# EasyEDA Pro project ProPrj_基于SAM2695的midiSynth模块_2026-04-13.epro

# Schematic Schematic1
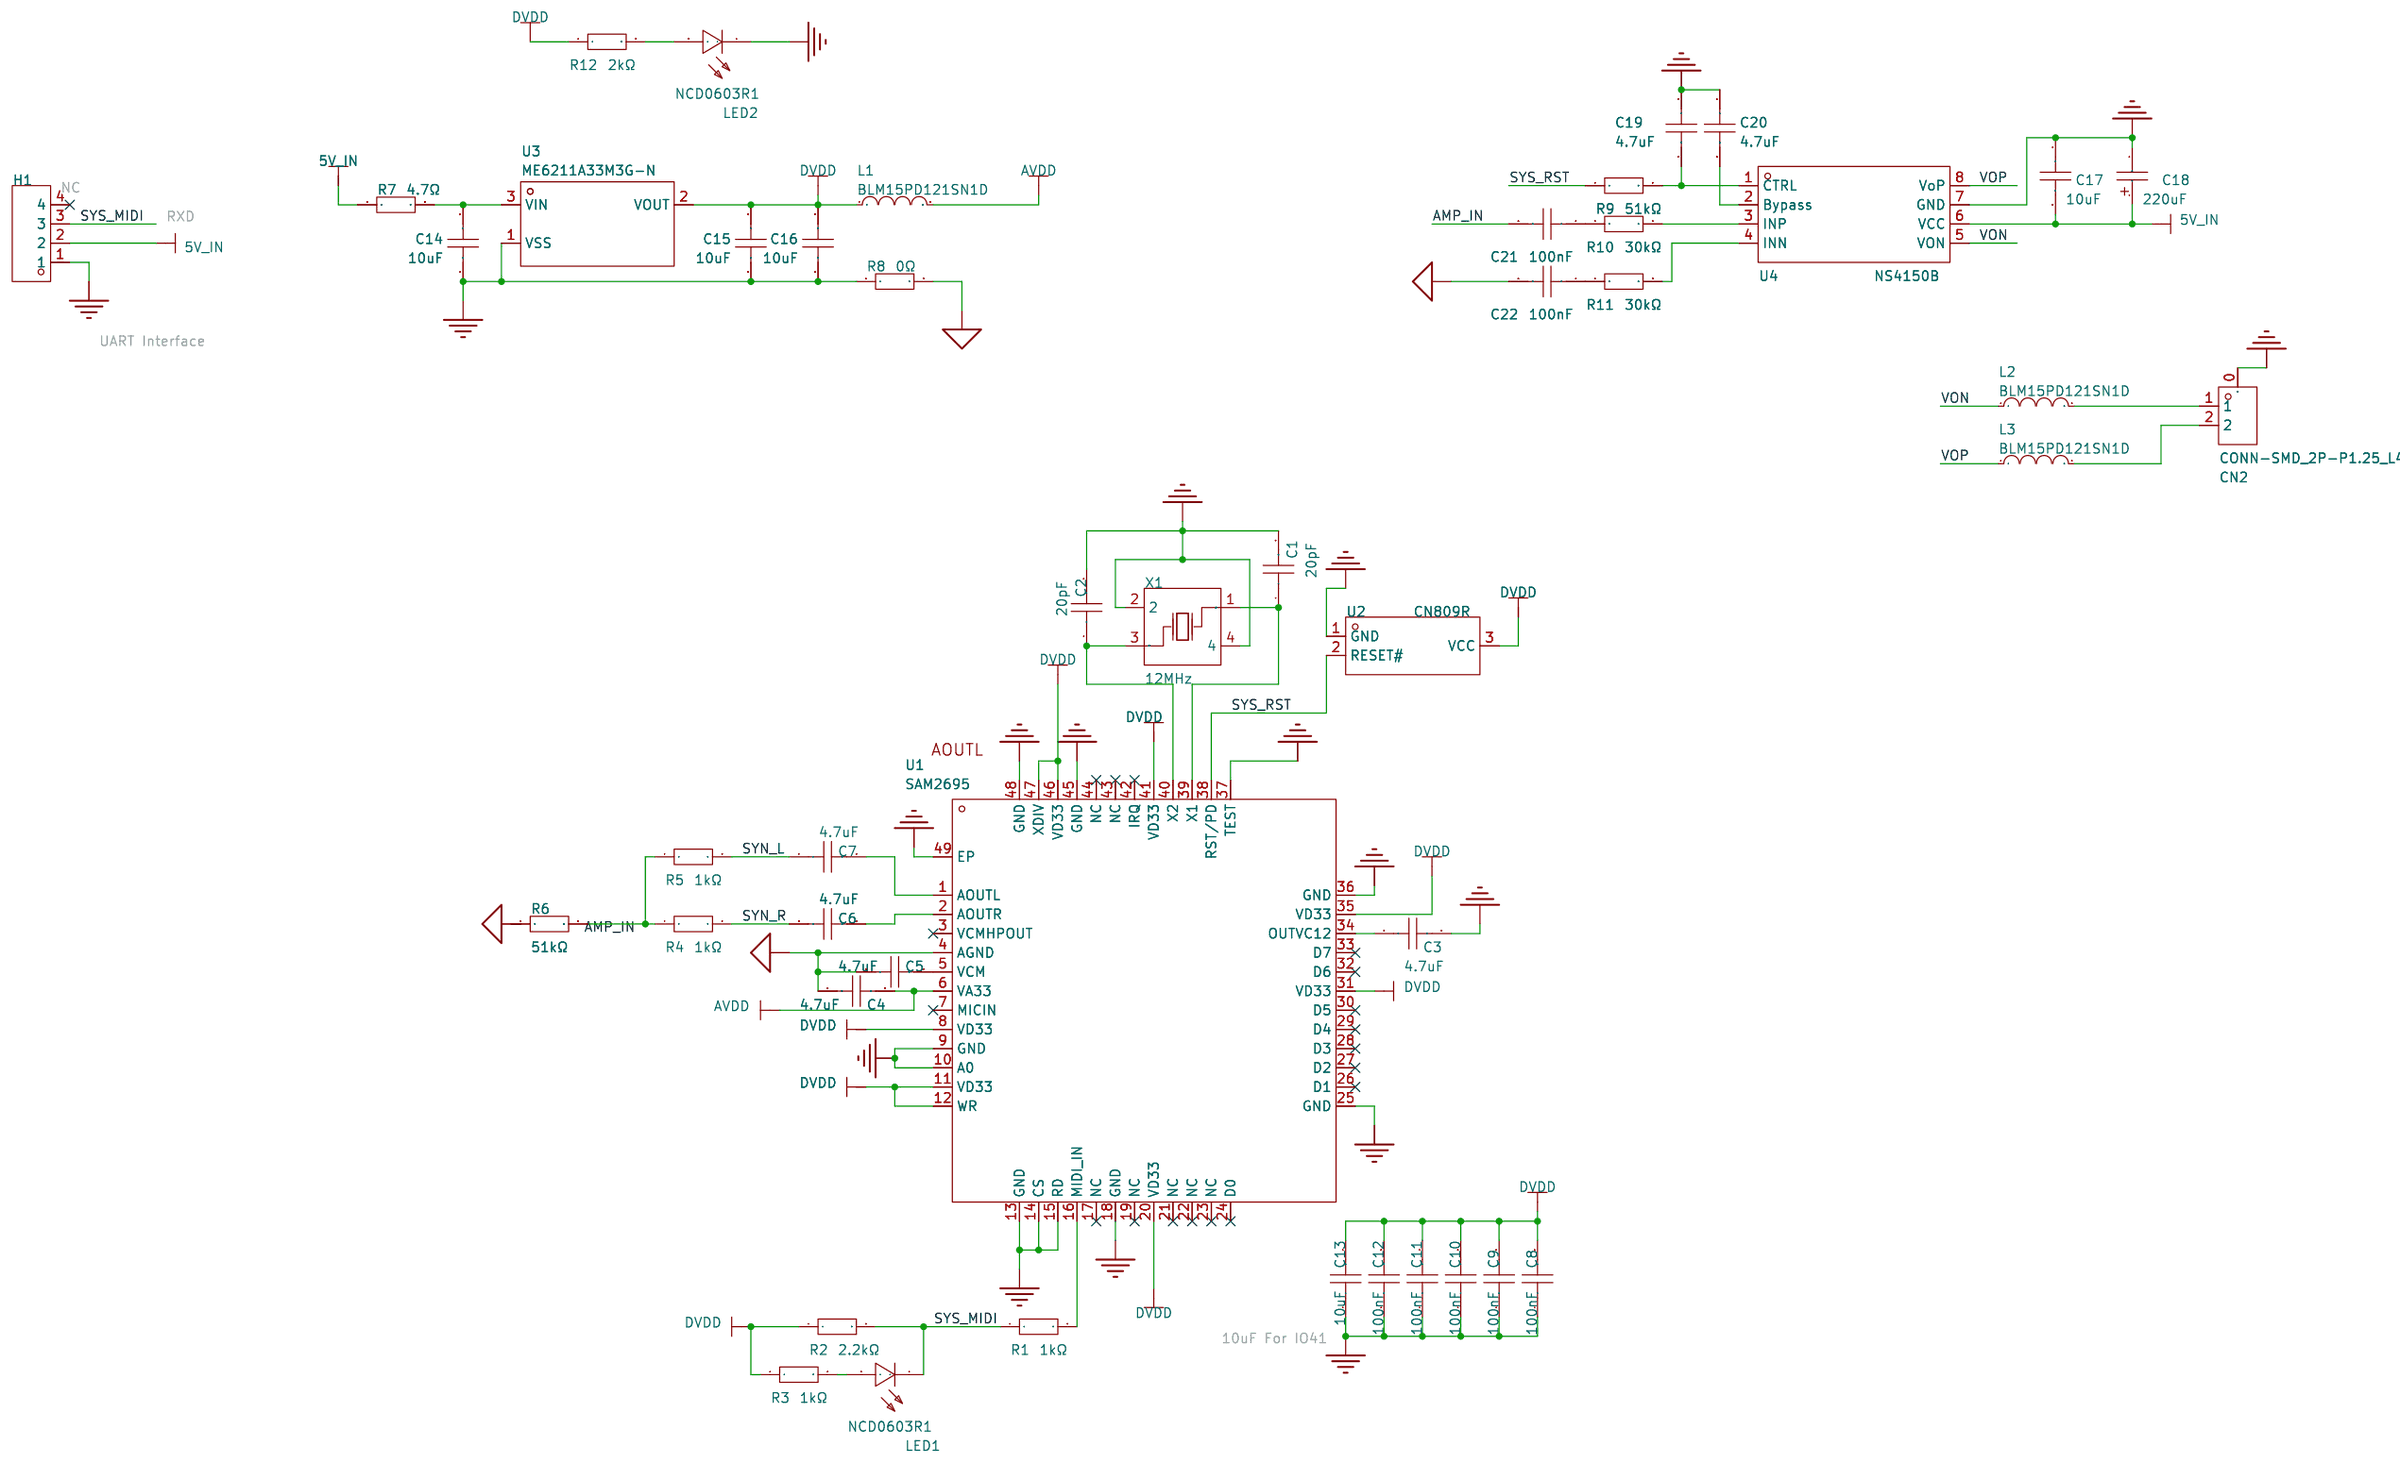
[diagram p0: schematic sheet]

## Parts
C1  20pF  [C0402]
C2  20pF  [C0402]
C3  4.7uF  [C0402]
C4  4.7uF  [C0402]
C5  4.7uF  [C0402]
C6  4.7uF  [C0402]
C7  4.7uF  [C0402]
C8  100nF  [C0402]
C9  100nF  [C0402]
C10  100nF  [C0402]
C11  100nF  [C0402]
C12  100nF  [C0402]
C13  10uF  [C0402]
C14  10uF  [C0402]
C15  10uF  [C0402]
C16  10uF  [C0402]
C17  10uF  [C0402]
C18  220uF  [CASE-B_3528]
C19  4.7uF  [C0402]
C20  4.7uF  [C0402]
C21  100nF  [C0402]
C22  100nF  [C0402]
CN2  CONN-SMD_2P-P1.25_L4.4-W7.4  [CONN-SMD_2P-P1.25_L4.4-W7.4]
H1  -  [HDR-TH_4P-P2.54-V-M]
L1  BLM15PD121SN1D  [L0402]
L2  BLM15PD121SN1D  [L0402]
L3  BLM15PD121SN1D  [L0402]
LED1  NCD0603R1  [LED0603-RD_RED]
LED2  NCD0603R1  [LED0603-RD_RED]
R1  1kΩ  [R0402]
R2  2.2kΩ  [R0402]
R3  1kΩ  [R0402]
R4  1kΩ  [R0402]
R5  1kΩ  [R0402]
R6  51kΩ  [R0402]
R7  4.7Ω  [R0402]
R8  0Ω  [R0402]
R9  51kΩ  [R0402]
R10  30kΩ  [R0402]
R11  30kΩ  [R0402]
R12  2kΩ  [R0402]
U1  SAM2695  [QFN-48_L6.0-W6.0-P0.40-TL-EP4.2]
U2  CN809R  [SOT-23-3_L2.9-W1.3-P1.90-LS2.4-BR]
U3  ME6211A33M3G-N  [SOT-23-3_L2.9-W1.6-P1.90-LS2.8-BR]
U4  NS4150B  [MSOP-8_L3.0-W3.0-P0.65-LS5.0-BL]
X1  12MHz  [CRYSTAL-SMD_4P-L2.5-W2.0-BL]

## Library data of the parts
C1 C2 = GRM1555C1H200JA01D: 容值:20pF;精度:±5%;额定电压:50V;材质(温度系数):C0G;; LCSC Part Name: 20pF ±5% 50V; Supplier Part: C76959; Manufacturer: muRata(村田); Supplier Footprint: 0402; Datasheet: https://atta.szlcsc.com/upload/public/pdf/source/20180307/C76959_15204091273971407747.pdf; Supplier: LCSC; Tolerance: ±5%; Voltage Rated: 50V; Temperature Coefficient: C0G
C3-C7 C19 C20 = GRM155R61E475ME15D: 容值:4.7uF;额定电压:25V;材质(温度系数):X5R;; LCSC Part Name: 4.7uF 25V; Supplier Part: C2858031; Manufacturer: muRata(村田); Supplier Footprint: 0402; Datasheet: https://atta.szlcsc.com/upload/public/pdf/source/20170523/1495533985505.pdf; Supplier: LCSC; Voltage Rated: 25V; Temperature Coefficient: X5R
C8-C12 C21 C22 = GRM155R71H104KE14D: 容值:100nF;精度:±10%;额定电压:50V;材质(温度系数):X7R;; LCSC Part Name: 100nF ±10% 50V; Supplier Part: C77020; Manufacturer: muRata(村田); Supplier Footprint: 0402; Datasheet: https://atta.szlcsc.com/upload/public/pdf/source/20180326/C77020_39BD49C951FF1AF0DB1F1FAC5AC1E401.pdf; Supplier: LCSC; Tolerance: ±10%; Voltage Rated: 50V; Temperature Coefficient: X7R
C13-C17 = GRM155R61A106ME44D: 容值:10uF;精度:±20%;额定电压:10V;材质(温度系数):X5R;; LCSC Part Name: 10uF ±20% 10V; Supplier Part: C77000; Manufacturer: muRata(村田); Supplier Footprint: 0402; Datasheet: https://atta.szlcsc.com/upload/public/pdf/source/20180530/C77000_4866797CFE3A842CD03C597EBD6AE6CD.pdf; Supplier: LCSC; Tolerance: ±20%; Voltage Rated: 10V; Temperature Coefficient: X5R
C18 = TLJB227M006R0500: 容值:220uF;精度:±20%;额定电压:6.3V;等效串联电阻:500mΩ@100kHz;; LCSC Part Name: 220uF ±20% 6.3V; Supplier Part: C30242; Manufacturer: Kyocera AVX; Supplier Footprint: CASE-B-3528; Datasheet: https://atta.szlcsc.com/upload/public/pdf/source/20181016/C313517_95E099C94D57B8A6005DAF15C3058A23.pdf; Supplier: LCSC; Tolerance: ±20%; Rated Voltage: 6.3V; Equivalent Series Resistance(ESR): 500mΩ@100kHz; Operating Temperature: -55℃~+125℃
CN2 = CONN-SMD_2P-P1.25_L4.4-W7.4: Supplier Part: C9900018342; Supplier Footprint: CONN-SMD_2P; JLCPCB Part Class: 扩展库; Supplier: LCSC
H1 = HDR-M_2.54_1x4P: Supplier Part: C492403; Supplier Footprint: 插件
L1-L3 = BLM15PD121SN1D: 标称阻抗@测试频率:120Ω@100MHz;误差:±25%;直流电阻(RDC):90mΩ;; LCSC Part Name: 单路 0402磁珠 阻抗120Ω@100MHz; Supplier Part: C76891; Manufacturer: muRata(村田); Supplier Footprint: 0402; Datasheet: https://atta.szlcsc.com/upload/public/pdf/source/20181120/C333978_3E581FB55966932B05020139ABDE8E01.pdf; Supplier: LCSC; Impedance @ Frequency: 120Ω@100MHz; Tolerance: ±25%; DC Resistance: 90mΩ; Current Rating: 1.3A; Circuits: 1
LED1 LED2 = NCD0603R1_C84263: 灯头类型:-;发光颜色:红色;正向电压(VF):1.6V~2.6V;功率:65mW;正向电流:20mA;主波长:615nm~630nm;二极管配置:独立二极管;透镜颜色:无色透明透镜;色温:-;发光强度:80mcd~220mcd;发光角度:130°;载带方式:-;工作温度:-30℃~+85℃;; Supplier Part: C84263; Manufacturer: 国星光电; Supplier Footprint: 0603; Datasheet: https://atta.szlcsc.com/upload/public/pdf/source/20200820/C84263_DABC6A75E58F576973B407FDBA283D60.pdf; Supplier: LCSC; Emitted Color: 红色; Forward Voltage (VF): 1.6V~2.6V; Power Dissipation: 65mW; Forward Current: 20mA; Dominant Wavelength: 615nm~630nm; Diode Configuration: 独立二极管; Lens Color: 无色透明透镜; Luminous Intensity: 80mcd~220mcd; Viewing Angle: 130°; Operating Temperature: -30℃~+85℃
R1 R3-R5 = 0402WGF1001TCE: 电阻类型:厚膜电阻;阻值:1kΩ;精度:±1%;功率:62.5mW;最大工作电压:50V;温度系数:±100ppm/℃;; LCSC Part Name: 1kΩ ±1% 62.5mW 厚膜电阻; Supplier Part: C11702; Manufacturer: UNI-ROYAL(厚声); Supplier Footprint: 0402; Datasheet: https://atta.szlcsc.com/upload/public/pdf/source/20200306/C422600_1E6D84923E4A46A82E41ADD87F860B5C.pdf; Supplier: LCSC; Type: 厚膜电阻; Tolerance: ±1%; Power(Watts): 62.5mW; Overload Voltage (Max): 50V; Temperature Coefficient: ±100ppm/℃; Operating Temperature Range: -55℃~+155℃
R2 = 0402WGF2201TCE: 电阻类型:厚膜电阻;阻值:2.2kΩ;精度:±1%;功率:62.5mW;最大工作电压:50V;温度系数:±100ppm/℃;; LCSC Part Name: 2.2kΩ ±1% 62.5mW 厚膜电阻; Supplier Part: C25879; Manufacturer: UNI-ROYAL(厚声); Supplier Footprint: 0402; Datasheet: https://atta.szlcsc.com/upload/public/pdf/source/20200306/C422600_1E6D84923E4A46A82E41ADD87F860B5C.pdf; Supplier: LCSC; Type: 厚膜电阻; Tolerance: ±1%; Power(Watts): 62.5mW; Overload Voltage (Max): 50V; Temperature Coefficient: ±100ppm/℃; Operating Temperature Range: -55℃~+155℃
R6 R9 = 0402WGF5102TCE: 电阻类型:厚膜电阻;阻值:51kΩ;精度:±1%;功率:62.5mW;最大工作电压:50V;温度系数:±100ppm/℃;; LCSC Part Name: 51kΩ ±1% 62.5mW 厚膜电阻; Supplier Part: C25794; Manufacturer: UNI-ROYAL(厚声); Supplier Footprint: 0402; Datasheet: https://atta.szlcsc.com/upload/public/pdf/source/20200306/C422600_1E6D84923E4A46A82E41ADD87F860B5C.pdf; Supplier: LCSC; Type: 厚膜电阻; Tolerance: ±1%; Power(Watts): 62.5mW; Overload Voltage (Max): 50V; Temperature Coefficient: ±100ppm/℃; Operating Temperature Range: -55℃~+155℃
R7 = 0402WGF470KTCE: 电阻类型:厚膜电阻;阻值:4.7Ω;精度:±1%;功率:62.5mW;最大工作电压:50V;温度系数:±200ppm/℃;; LCSC Part Name: 4.7Ω ±1% 62.5mW 厚膜电阻; Supplier Part: C25121; Manufacturer: UNI-ROYAL(厚声); Supplier Footprint: 0402; Datasheet: https://atta.szlcsc.com/upload/public/pdf/source/20200306/C422600_1E6D84923E4A46A82E41ADD87F860B5C.pdf; Supplier: LCSC; Type: 厚膜电阻; Tolerance: ±1%; Power(Watts): 62.5mW; Overload Voltage (Max): 50V; Temperature Coefficient: ±200ppm/℃; Operating Temperature Range: -55℃~+155℃
R8 = 0402WGF0000TCE: 电阻类型:厚膜电阻;阻值:0Ω;精度:±1%;功率:62.5mW;最大工作电压:50V;温度系数:±800ppm/℃;; LCSC Part Name: 0Ω ±1% 62.5mW 厚膜电阻; Supplier Part: C17168; Manufacturer: UNI-ROYAL(厚声); Supplier Footprint: 0402; Datasheet: https://atta.szlcsc.com/upload/public/pdf/source/20200306/C422600_1E6D84923E4A46A82E41ADD87F860B5C.pdf; Supplier: LCSC; Type: 厚膜电阻; Tolerance: ±1%; Power(Watts): 62.5mW; Overload Voltage (Max): 50V; Temperature Coefficient: ±800ppm/℃; Operating Temperature Range: -55℃~+155℃
R10 R11 = 0402WGF3002TCE: 电阻类型:厚膜电阻;阻值:30kΩ;精度:±1%;功率:62.5mW;最大工作电压:50V;温度系数:±100ppm/℃;; LCSC Part Name: 30kΩ ±1% 62.5mW 厚膜电阻; Supplier Part: C25776; Manufacturer: UNI-ROYAL(厚声); Supplier Footprint: 0402; Datasheet: https://atta.szlcsc.com/upload/public/pdf/source/20200306/C422600_1E6D84923E4A46A82E41ADD87F860B5C.pdf; Supplier: LCSC; Type: 厚膜电阻; Tolerance: ±1%; Power(Watts): 62.5mW; Overload Voltage (Max): 50V; Temperature Coefficient: ±100ppm/℃; Operating Temperature Range: -55℃~+155℃
R12 = 0402WGF2001TCE: 电阻类型:厚膜电阻;阻值:2kΩ;精度:±1%;功率:62.5mW;最大工作电压:50V;温度系数:±100ppm/℃;; LCSC Part Name: 2kΩ ±1% 62.5mW 厚膜电阻; Supplier Part: C4109; Manufacturer: UNI-ROYAL(厚声); Supplier Footprint: 0402; Datasheet: https://atta.szlcsc.com/upload/public/pdf/source/20200306/C422600_1E6D84923E4A46A82E41ADD87F860B5C.pdf; Supplier: LCSC; Type: 厚膜电阻; Tolerance: ±1%; Power(Watts): 62.5mW; Overload Voltage (Max): 50V; Temperature Coefficient: ±100ppm/℃; Operating Temperature Range: -55℃~+155℃
U1 = SAM2695: Supplier Part: C2894839; Supplier Footprint: QFN-48-EP(6x6); JLCPCB Part Class: 扩展库; Supplier: LCSC
U2 = CN809R: Supplier Part: C840519; Manufacturer: CONSONANCE(上海如韵); Supplier Footprint: SOT-23-3; Datasheet: https://atta.szlcsc.com/upload/public/pdf/source/20200918/C840515_7DFC99A23260E65C6304EE619FD5F333.pdf; Supplier: LCSC
U3 = ME6211A33M3G-N: 输出类型:固定;最大输入电压:6V;输出电压:3.3V;最大输出电流:500mA;电源纹波抑制比(PSRR):70dB;输出极性:正极;; LCSC Part Name: 输入6V 输出3.3V 500mA; Supplier Part: C168807; Manufacturer: MICRONE(南京微盟); Supplier Footprint: SOT-23; Datasheet: https://atta.szlcsc.com/upload/public/pdf/source/20180224/C168807_15194366627921363679.pdf; Supplier: LCSC; Output Type: 固定; Maximum Input Voltage: 6V; Output Voltage: 3.3V; MAX Output Current: 500mA; Power Supply Rejection Ratio (PSRR): 70dB; Dropout Voltage: 260mV@(200mA); Output Polarity: 正极; Number of Outputs: 1
U4 = NS4150B_C189961: 功放类型:D类功放;输出功率:3Wx1@4Ω;; Supplier Part: C189961; Manufacturer: Nsiway(纳芯威); Supplier Footprint: MSOP-8; Datasheet: https://atta.szlcsc.com/upload/public/pdf/source/20220916/DAE631F3909B9CBB38BDE76E3E6D5896.pdf; Supplier: LCSC; Type of Power Amplifier: D类功放; Output Power: 3Wx1@4Ω; Supply Voltage: 3V~5.25V
X1 = TXM12M0004252LBCEO00T: 晶振类型:贴片晶振;频率:12MHz;常温频差:±10ppm;外接负载电容:20pF;频率稳定度(全温):±30ppm;; LCSC Part Name: 12MHz ±10ppm 20pF; Supplier Part: C284156; Manufacturer: YJX(雅晶鑫); Supplier Footprint: SMD2520-4P; Datasheet: https://atta.szlcsc.com/upload/public/pdf/source/20180910/C284156_33E9081587E4031EDA871554E6F6FE96.pdf; Supplier: LCSC; Crystal Type: 贴片晶振; Normal temperature Frequency Tolerance: ±10ppm; External load capacitor: 20pF; Frequency Stability(Full temperature range): ±30ppm; Equivalent Series Resistance (ESR): 120Ω; Operating Temperature: -40℃~+85℃

## Nets
5V_IN: C17.2 C18.1 H1.2 R7.1 U4.6(VCC)
AGND: C4.1 C5.1 C22.2 R6.1 R8.2 U1.4(AGND)
AVDD: C4.2 L1.2 U1.6(VA33)
DVDD: C8.2 C9.2 C10.2 C11.2 C12.2 C13.2 C15.2 C16.2 L1.1 R2.1 R3.1 R12.1 U1.8(VD33) U1.11(VD33) U1.12(WR) U1.20(VD33) U1.31(VD33) U1.35(VD33) U1.41(VD33) U1.46(VD33) U1.47(XDIV) U2.3(VCC) U3.2(VOUT)
GND: C1.2 C2.2 C3.2 C8.1 C9.1 C10.1 C11.1 C12.1 C13.1 C14.1 C15.1 C16.1 C17.1 C18.2 C19.2 C20.2 CN2.0 H1.1 LED2.1(K) R8.1 U1.9(GND) U1.10(A0) U1.13(GND) U1.14(CS) U1.15(RD) U1.18(GND) U1.25(GND) U1.36(GND) U1.37(TEST) U1.45(GND) U1.48(GND) U1.49(EP) U2.1(GND) U3.1(VSS) U4.7(GND) X1.2 X1.4
AMP_IN: C21.2 R4.1 R5.1 R6.2
SYN_L: C7.1 R5.2
SYN_R: C6.1 R4.2
SYS_MIDI: H1.3 LED1.1(K) R1.1 R2.2
SYS_RST: R9.1 U1.38(RST/PD) U2.2(RESET#)
VON: L2.1 U4.5(VON)
VOP: L3.1 U4.8(VoP)
$1N621: C3.1 U1.34(OUTVC12)
$1N927: C2.1 U1.40(X2) X1.3(OSC2)
$1N941: C1.1 U1.39(X1) X1.1(OSC1)
$1N1407: R1.2 U1.16(MIDI_IN)
$1N1648: LED1.2(A) R3.2
$1N1866: C5.2 U1.5(VCM)
$1N1969: C6.2 U1.2(AOUTR)
$1N2010: C7.2 U1.1(AOUTL)
$1N2925: C14.2 R7.2 U3.3(VIN)
$1N3698: C19.1 R9.2 U4.1(CTRL)
$1N3770: C20.1 U4.2(Bypass)
$1N3844: R10.2 U4.3(INP)
$1N3921: R11.2 U4.4(INN)
$1N3961: C21.1 R10.1
$1N4002: C22.1 R11.1
$1N4108: CN2.2 L3.2
$1N4183: CN2.1 L2.2
$1N4483: LED2.2(A) R12.2

Not connected (* = marked no-connect by the designer): H1 4*; U1 3(VCMHPOUT)* 7(MICIN)* 17(NC)* 19(NC)* 21(NC)* 22(NC)* 23(NC)* 24(D0)* 26(D1)* 27(D2)* 28(D3)* 29(D4)* 30(D5)* 32(D6)* 33(D7)* 42(IRQ)* 43(NC)* 44(NC)*

## Notes on the sheet
- NC
- RXD
- UART Interface
- 10uF For IO41

# Board PCB1
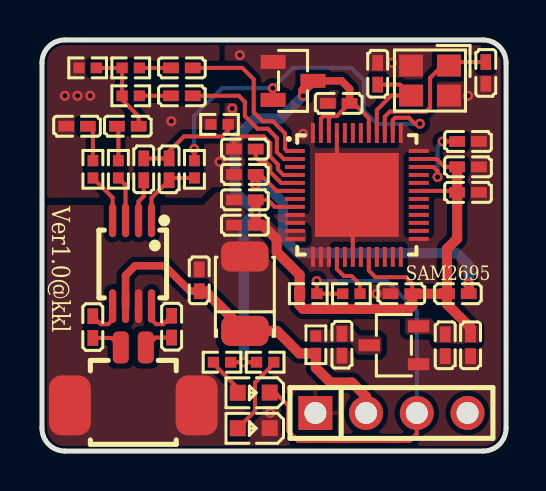
[diagram p1: board, top side]
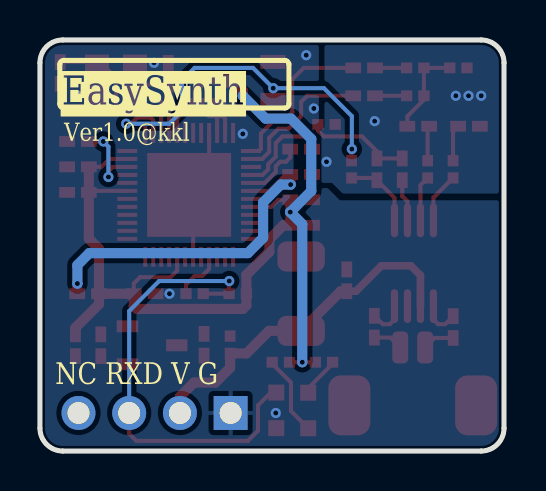
[diagram p2: board, bottom side, seen from below]

Outline 23.24 x 20.57 mm; copper layers: Top Layer, Bottom Layer. Coordinates in mm from the lower left corner of the outline.
Outline path: 0,19.43 0,1.14 arc(0.33,0.33) 1.14,0 22.1,0 arc(22.91,0.33) 23.24,1.14 23.24,19.43 arc(22.91,20.24) 22.1,20.57 1.14,20.57 arc(0.33,20.24) 0,19.43
Stack: Top Layer 0.035mm / Dielectric1 1.51mm FR4 er 4.5 / Bottom Layer 0.035mm

## Design rules (mm)
net VOP: DP1
net VON: DP1
net $1N4183: DP2
net $1N4108: DP2
template: 自定义配置
spacing copperThickness1oz (default): track to track 0.102, other pairs 0.152 to 0.3
spacing copperThickness2oz: track to track 0.203, other pairs 0.152 to 0.3
track width copperThickness1oz (default): min 0.127, default 0.254, max 2.54
track width copperThickness2oz: min 0.203, default 0.254, max 2.54
differential pair differentialPair (default): width min 0.127, default 0.254, max 2.54; gap min 0.152, default 0.152
via viaSize (default): diameter min 0.5, default 0.61, max 10; hole min 0.254, default 0.305, max 6.3

## Placement (name value [footprint] x y rotation side)
C1  20pF  [C0402]  22.23 18.92 270 top
C2  20pF  [C0402]  16.81 18.88 90 top
C3  4.7uF  [C0402]  21.34 15.49 0 top
C4  4.7uF  [C0402]  10.16 13.84 0 top
C5  4.7uF  [C0402]  10.16 15.11 0 top
C6  4.7uF  [C0402]  7.01 17.78 0 top
C7  4.7uF  [C0402]  7.01 19.18 0 top
C8  100nF  [C0402]  10.16 11.3 0 top
C9  100nF  [C0402]  21.34 14.22 180 top
C10  100nF  [C0402]  21.34 12.95 180 top
C11  100nF  [C0402]  18 7.87 0 top
C12  100nF  [C0402]  10.16 12.57 0 top
C13  10uF  [C0402]  14.86 17.4 0 top
C14  10uF  [C0402]  15.02 5.32 90 top
C15  10uF  [C0402]  20.19 5.29 90 top
C16  10uF  [C0402]  21.46 5.29 90 top
C17  10uF  [C0402]  7.87 8.54 270 top
C18  220uF  [CASE-B_3528]  10.16 7.87 90 top
C19  4.7uF  [C0402]  6.37 14.1 90 top
C20  4.7uF  [C0402]  5.1 14.1 90 top
C21  100nF  [C0402]  4.3 16.26 0 top
C22  100nF  [C0402]  1.75 16.26 180 top
CN2  -  [CONN-SMD_2P-P1.25_L4.4-W7.4]  4.57 3.74 0 top
H1  -  [HDR-TH_4P-P2.54-V-M]  17.5 1.9 0 top
L1  BLM15PD121SN1D  [L0402]  20.83 7.87 0 top
L2  BLM15PD121SN1D  [L0402]  2.54 6.2 270 top
L3  BLM15PD121SN1D  [L0402]  6.49 6.22 270 top
LED1  NCD0603R1  [LED0603-RD_RED]  10.61 2.92 180 top
LED2  NCD0603R1  [LED0603-RD_RED]  10.61 1.14 180 top
R1  1kΩ  [R0402]  15.49 7.87 0 top
R2  2.2kΩ  [R0402]  13.34 7.87 0 top
R3  1kΩ  [R0402]  9.02 4.44 180 top
R4  1kΩ  [R0402]  4.45 17.78 0 top
R5  1kΩ  [R0402]  4.45 19.18 0 top
R6  51kΩ  [R0402]  2.29 19.18 0 top
R7  4.7Ω  [R0402]  13.72 5.32 90 top
R8  0Ω  [R0402]  8.89 16.35 180 top
R9  51kΩ  [R0402]  7.64 14.1 270 top
R10  30kΩ  [R0402]  3.83 14.1 270 top
R11  30kΩ  [R0402]  2.55 14.1 270 top
R12  2kΩ  [R0402]  11.18 4.44 0 top
U1  SAM2695  [QFN-48_L6.0-W6.0-P0.40-TL-EP4.2]  15.77 12.82 0 top
U2  CN809R  [SOT-23-3_L2.9-W1.3-P1.90-LS2.4-BR]  12.57 18.53 180 top
U3  ME6211A33M3G-N  [SOT-23-3_L2.9-W1.6-P1.90-LS2.8-BR]  17.62 5.29 0 top
U4  NS4150B  [MSOP-8_L3.0-W3.0-P0.65-LS5.0-BL]  4.51 9.4 180 top
X1  12MHz  [CRYSTAL-SMD_4P-L2.5-W2.0-BL]  19.43 18.54 180 top

## Footprints (pads in the part's own frame, mm; a bottom-side part is the same pattern mirrored in y, then rotated)
C0402
  rect 0.79x0.54 smd: 1(-0.545,0) 2(0.545,0)
CASE-B_3528
  rrect 1.506x2.376 smd: 1(-1.861,0) 2(1.861,0)
CONN-SMD_2P-P1.25_L4.4-W7.4
  rrect 2.1x3 smd: 0(-3.175,-1.45) 0(3.175,-1.45)
  rrect 0.8x1.6 smd: 1(-0.625,1.45) 2(0.625,1.45)
CRYSTAL-SMD_4P-L2.5-W2.0-BL
  rect 1.2x1.1 smd: 1(-0.95,-0.75) 2(0.95,-0.75) 3(0.95,0.75) 4(-0.95,0.75)
HDR-TH_4P-P2.54-V-M
  rect 1.7x1.7 hole 1.1: 1(-3.81,0)
  round 1.7 hole 1.1: 2(-1.27,0) 3(1.27,0) 4(3.81,0)
L0402
  rect 0.79x0.54 smd: 1(-0.545,0) 2(0.545,0)
LED0603-RD_RED
  rect 0.8x0.8 smd: 1(-0.799,-0.004) 2(0.799,0.004)
MSOP-8_L3.0-W3.0-P0.65-LS5.0-BL
  oval 0.364x1.692 smd: 1(-0.975,-2.146) 2(-0.325,-2.146) 3(0.325,-2.146) 4(0.975,-2.146) 5(0.975,2.146) 6(0.325,2.146) 7(-0.325,2.146) 8(-0.975,2.146)
QFN-48_L6.0-W6.0-P0.40-TL-EP4.2
  rect 1x0.2 smd: 1(-3.1,2.2) 2(-3.1,1.8) 3(-3.1,1.4) 4(-3.1,1) 5(-3.1,0.6) 6(-3.1,0.2) 7(-3.1,-0.2) 8(-3.1,-0.6) 9(-3.1,-1) 10(-3.1,-1.4) 11(-3.1,-1.8) 12(-3.1,-2.2) 25(3.1,-2.2) 26(3.1,-1.8) 27(3.1,-1.4) 28(3.1,-1) 29(3.1,-0.6) 30(3.1,-0.2) 31(3.1,0.2) 32(3.1,0.6) 33(3.1,1) 34(3.1,1.4) 35(3.1,1.8) 36(3.1,2.2)
  rect 0.2x1 smd: 13(-2.2,-3.1) 14(-1.8,-3.1) 15(-1.4,-3.1) 16(-1,-3.1) 17(-0.6,-3.1) 18(-0.2,-3.1) 19(0.2,-3.1) 20(0.6,-3.1) 21(1,-3.1) 22(1.4,-3.1) 23(1.8,-3.1) 24(2.2,-3.1) 37(2.2,3.1) 38(1.8,3.1) 39(1.4,3.1) 40(1,3.1) 41(0.6,3.1) 42(0.2,3.1) 43(-0.2,3.1) 44(-0.6,3.1) 45(-1,3.1) 46(-1.4,3.1) 47(-1.8,3.1) 48(-2.2,3.1)
  rect 4.2x4.2 smd: 49(0,0)
R0402
  rect 0.566x0.54 smd: 1(-0.433,0) 2(0.433,0)
SOT-23-3_L2.9-W1.3-P1.90-LS2.4-BR
  rect 1.25x0.7 smd: 1(1,-0.95) 2(1,0.95) 3(-1,0)
SOT-23-3_L2.9-W1.6-P1.90-LS2.8-BR
  rect 1.07x0.6 smd: 1(1.235,-0.95) 2(1.235,0.95) 3(-1.235,0)

## Nets
As in the schematic.

Pads without a net: H1 4; U1 3 7 17 19 21 22 23 24 26 27 28 29 30 32 33 42 43 44

## Via types
v1: diameter 0.508, hole 0.254, Top Layer to Bottom Layer, 23 vias

## Routing (per net, layer and track width the routed paths; a pad name or vN(x,y) marks a point on that pad's centre or on a via; arc(x,y) is an arc through that point)
5V_IN: length 17.7
  Top Layer w0.381: C17.2 7.41,8 6.14,9.27 4.66,9.27 4.19,8.79 U4.6
  Top Layer w0.508: C17.2 8.17,8 C18.1 11.77,6.01 12.89,4.89 13.72,4.89 13.72,4.17 14.46,3.43 15.52,3.43 16.23,2.72 H1.2
AGND: length 4.9
  Top Layer w0.203: C5.1 9.62,15.46 9.91,15.75 11.09,15.75 11.43,15.41 11.43,14.73 11.81,14.35 11.81,14.1 12.09,13.82 U1.4
  vias: v1(1.14,17.78) v1(1.78,17.78) v1(2.41,17.78) v1(6.48,16.51) v1(8.89,14.48)
AVDD: length 17.6
  Top Layer w0.203: C4.2 10.92,13.84 11.75,13.02 U1.6
  Top Layer w0.508: v1(10.68,13.33) 10.68,13.82 C4.2 ; v1(21.37,8.38) 21.37,8.37 L1.2
  Bottom Layer w0.508: v1(10.68,13.33) 11.18,13.33 12.07,12.45 12.07,10.67 12.83,9.91 20.77,9.91 21.37,9.31 v1(21.37,8.38)
DVDD: length 59.9
  Top Layer w0.203: 13.97,15.92 13.97,16.64 14.09,16.76 14.47,16.76 ; U1.41 16.37,16.65 15.62,17.4 C13.2 14.77,16.76 14.47,16.76 ; U1.20 16.37,9.03 16.7,8.7 18.22,8.7 18.54,8.38 C11.2 ; C10.2 20.72,13.02 U1.31 ; R12.1 v1(10.1,4.44) R3.1 ; 14.47,16.76 14.37,16.67 U1.46 ; C12.2 11.3,12.57 11.66,12.22 U1.8 ; C9.2 20.16,14.22 19.77,14.62 18.87,14.62
  Top Layer w0.381: C13.2 15.4,18.12 15,18.53 U2.3
  Top Layer w0.508: L1.1 20.28,10.12 20.79,10.63 C10.2 C9.2 ; L1.1 20.28,7.35 21.46,6.17 C16.2 ; L1.1 C11.2 18.54,7.26 18.39,7.11 13.08,7.11 12.9,7.29 R2.1 12.9,8.81 11.75,9.96 11.75,10.6 11.05,11.3 C8.2 v1(10.71,11.96) C12.2 ; U2.3 13.08,18.03 v1(13.08,17.78)
  Bottom Layer w0.508: v1(10.1,4.44) 10.1,11.36 v1(10.71,11.96) 9.65,13.01 9.65,15.62 10.67,16.64 11.94,16.64 v1(13.08,17.78)
GND: length 12
  Top Layer w0.203: U1.18 15.57,12.62 U1.49 14.77,13.82 U1.45 ; R8.1 9.32,16.05 9.02,15.75 7.11,15.75 6.37,15 C19.2 C20.2
  vias: v1(9.53,17.14) v1(9.91,19.81) v1(11.43,1.9) v1(13.08,15.88) v1(16.75,7.87) v1(17.53,19.43) v1(21.34,17.78)
AMP_IN: length 4.6
  Top Layer w0.203: R6.2 4.01,19.18 4.01,17.58 4.84,16.75 C21.2
SYN_L: length 1.6
  Top Layer w0.203: R5.2 C7.1
SYN_R: length 1.6
  Top Layer w0.203: R4.2 C6.1
SYS_MIDI: length 23
  Top Layer w0.203: LED1.1 11.68,2.92 12.32,2.29 12.32,1.02 12.83,0.51 18.42,0.51 18.77,0.86 H1.3 ; R1.1 R2.2 13.77,8.5 v1(13.76,8.51)
  Bottom Layer w0.203: H1.3 18.77,7.01 17.27,8.51 v1(13.76,8.51)
SYS_RST: length 19.4
  Top Layer w0.203: U2.2 11.57,18.14 v1(11.56,18.16) ; v1(7.62,15.11) 7.64,15.1 R9.1 ; U1.38 17.57,16.56 17.69,16.68 18.37,16.68 18.67,16.38 v1(18.92,16.38)
  Bottom Layer w0.203: v1(18.92,16.38) 16.76,16.38 16.13,17.02 16.13,18.54 15.49,19.18 12.57,19.18 v1(11.56,18.16) 9.02,18.16 7.62,16.76 v1(7.62,15.11)
VON: length 1.9
  Top Layer w0.203: U4.5 3.54,6.58 3.3,6.35 2.94,6.35 L2.1
VOP: length 1.9
  Top Layer w0.203: U4.8 5.49,6.58 5.72,6.35 6.07,6.35 L3.1
$1N621: length 3.9
  Top Layer w0.203: v1(20.07,15.49) C3.1 ; v1(19.81,13.72) 19.81,14 19.6,14.22 U1.34
  Bottom Layer w0.203: v1(20.07,15.49) 19.81,15.24 v1(19.81,13.72)
$1N927: length 5.1
  Top Layer w0.203: C2.1 17.94,18.34 X1.3 17.49,17.79 16.77,17.07 U1.40
$1N941: length 7.9
  Top Layer w0.203: C1.1 20.56,19.47 X1.1 20.05,19.29 19.43,18.67 19.43,17.19 19.23,16.99 17.42,16.99 17.17,16.73 U1.39
$1N1407: length 2.5
  Top Layer w0.203: U1.16 14.77,9.11 15.11,8.76 15.49,8.76 15.93,8.33 R1.2
$1N1648: length 2
  Top Layer w0.203: 8.58,4.44 8.58,4.37 9.81,3.15 LED1.2
$1N1866: length 3.1
  Top Layer w0.203: C5.2 10.71,14.69 10.92,14.48 11.21,14.48 11.43,14.26 11.43,13.97 11.98,13.42 U1.5
$1N1969: length 7.3
  Top Layer w0.203: C6.2 9.86,17.78 10.16,17.47 10.16,16.76 10.8,16.13 11.3,16.13 11.76,15.67 11.76,14.97 12.11,14.62 12.67,14.62
$1N2010: length 8.3
  Top Layer w0.203: U1.1 12.28,15.02 12.17,15.12 12.17,15.89 11.56,16.51 11.05,16.51 10.6,16.96 10.6,18.61 10.03,19.18 C7.2
$1N3698: length 3.7
  Top Layer w0.203: U4.1 5.49,12.68 C19.1 6.48,13.67 R9.2
$1N3770: length 2.1
  Top Layer w0.203: C20.1 5.1,12.75 4.84,12.49 U4.2
$1N3844: length 2.3
  Top Layer w0.203: U4.3 4.19,13.31 R10.2
$1N3921: length 2.5
  Top Layer w0.203: U4.4 3.54,12.68 R11.2
$1N3961: length 1.8
  Top Layer w0.203: C21.1 3.83,16.18 R10.1
$1N4002: length 1.8
  Top Layer w0.203: C22.1 2.55,16 R11.1
$1N4108: length 1.5
  Top Layer w0.203: L3.2 5.69,5.68 CN2.2
$1N4183: length 1.6
  Top Layer w0.203: L2.2 3.47,5.66 CN2.1
$1N4483: length 4.1
  Top Layer w0.203: LED2.2 10.67,2 10.67,3.43 11.61,4.37 R12.2

## Copper pours and planes (outline as drawn; the poured copper is in the pictures)
AGND on Top Layer: 8.89,20.85 8.89,16 9.04,15.85 10.07,15.85 10.16,15.76 10.16,13.33 10.03,13.21 8.51,13.21 7.98,12.68 -0.48,12.68 -1.02,13.21 -1.02,20.83 -0.38,21.46 8.28,21.46
AGND on Bottom Layer: 8.99,21.06 8.99,16.21 9.14,16.06 10.17,16.06 10.26,15.98 10.26,13.55 10.13,13.42 8.61,13.42 8.08,12.89 -0.38,12.89 -0.92,13.42 -0.92,21.04 -0.28,21.68 8.38,21.68
DVDD on Top Layer: 18.18,6.57 18.26,6.65 19.45,6.65 19.79,6.32 21.8,6.32 21.89,6.23 21.89,5.44 21.8,5.36 19.77,5.36 19.67,5.45 19.67,5.71 19.55,5.83 18.27,5.83 18.18,5.92
DVDD on Top Layer: 10.33,11.63 11.31,11.63 11.77,11.18 13.18,11.18 13.24,11.11 13.24,10.5 13.19,10.45 11.62,10.45 11.08,10.98 10.34,10.98 10.24,11.08 10.24,11.54
GND on Top Layer: 9.78,21.46 9.14,20.83 9.14,16.26 9.27,16.13 10.18,16.13 10.41,15.89 10.41,13.21 10.16,12.95 8.72,12.95 8.09,12.32 -0.38,12.32 -0.89,11.81 -0.89,0 -0.13,-0.76 23.5,-0.76 24.13,-0.13 24.13,20.54 23.21,21.46
GND on Bottom Layer: 9.91,21.69 9.27,21.06 9.27,16.49 9.4,16.36 10.3,16.36 10.54,16.12 10.54,13.44 10.29,13.18 8.85,13.18 8.21,12.55 -0.26,12.55 -0.76,12.05 -0.76,0.23 0,-0.53 23.62,-0.53 24.26,0.1 24.26,20.77 23.34,21.69
$1N2925 on Top Layer: 13.37,6.1 14.43,6.1 14.68,6.35 15.32,6.35 15.88,5.79 16.87,5.79 17.02,5.64 17.02,4.95 16.88,4.82 15.85,4.82 15.62,5.04 15.62,5.21 15.43,5.4 13.37,5.4

## Text on the board
Bottom Silkscreen Layer: Ver1.0@kkl | NC RXD V G | EasySynth
Top Silkscreen Layer: SAM2695 | Ver1.0@kkl
